# Altium schematic sheet USB Ports.SchDoc: USB Ports
size A3; DocumentNumber: 6; SheetNumber: 6; SheetTotal: 9
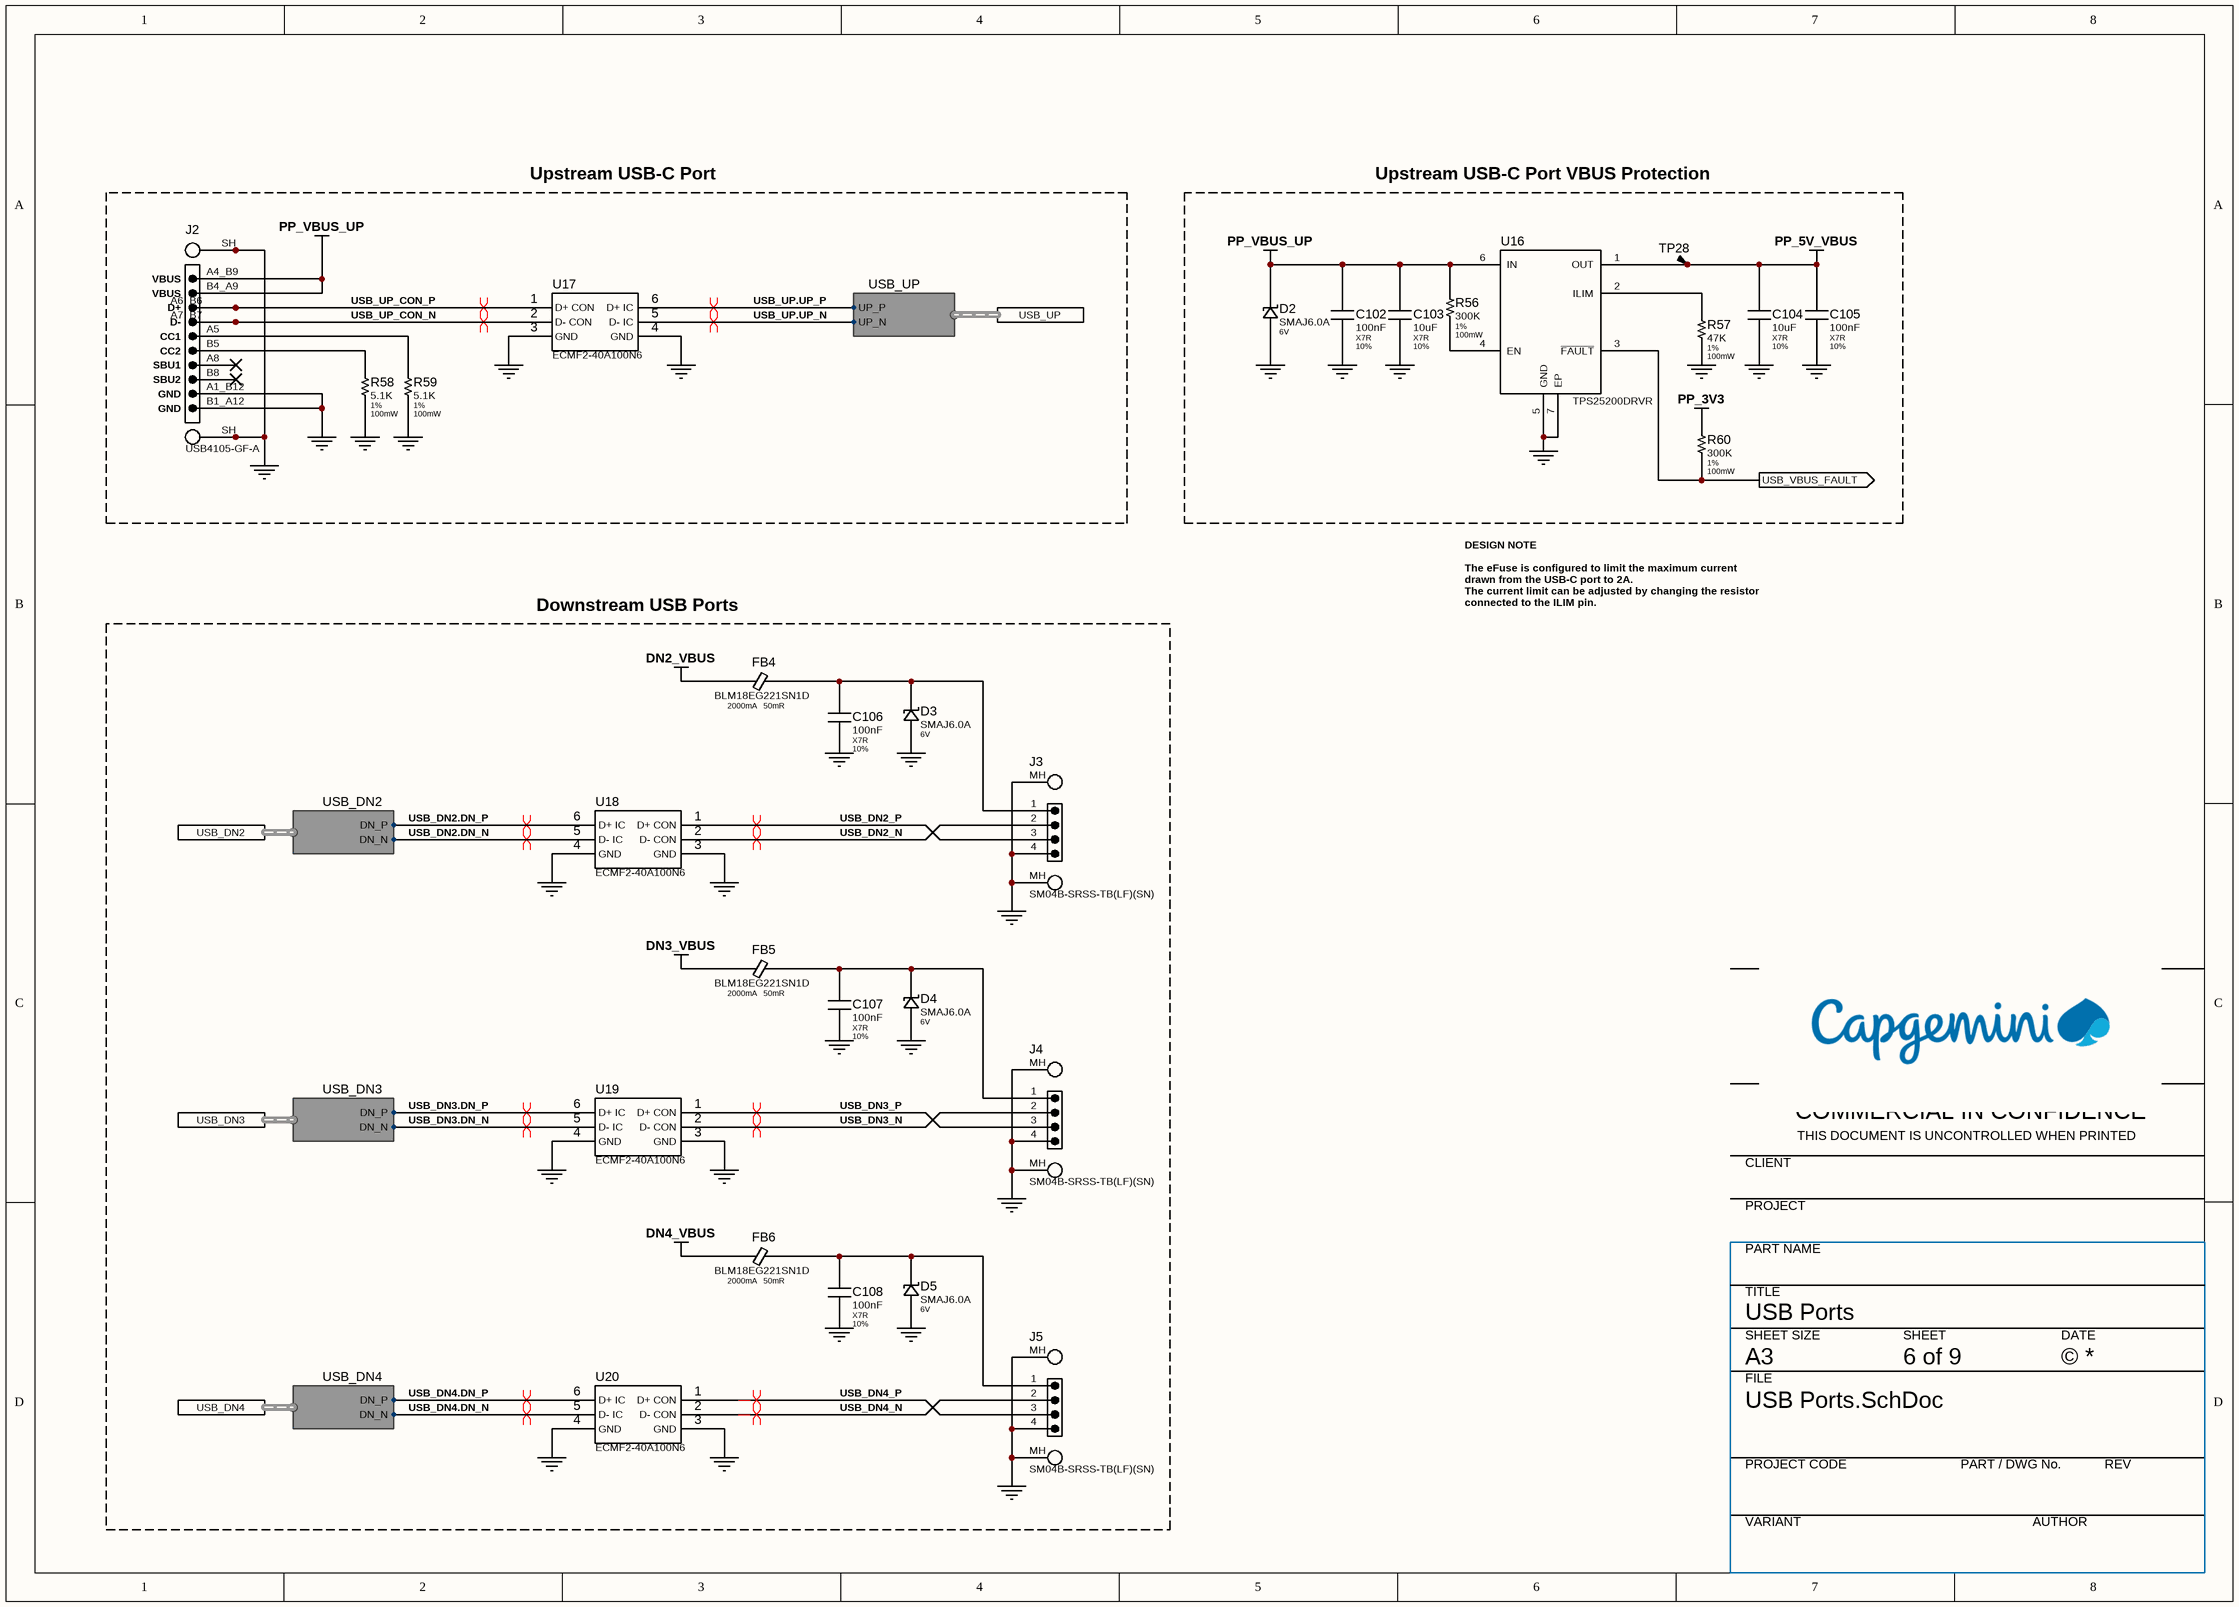
[diagram p0: USB Ports.SchDoc]

## Parts
C102  100nF  Dielectric: X7R  Tolerance: 10%  [MLCC-0402-N]
C103  10uF  Dielectric: X7R  Tolerance: 10%  [MLCC-1206-N]
C104  10uF  Dielectric: X7R  Tolerance: 10%  [MLCC-1206-N]
C105  100nF  Dielectric: X7R  Tolerance: 10%  [MLCC-0402-N]
C106  100nF  Dielectric: X7R  Tolerance: 10%  [MLCC-0402-N]
C107  100nF  Dielectric: X7R  Tolerance: 10%  [MLCC-0402-N]
C108  100nF  Dielectric: X7R  Tolerance: 10%  [MLCC-0402-N]
D2  SMAJ6.0A  Voltage - Reverse: 6V  [JEDEC-DO-214AC-N]
D3  SMAJ6.0A  Voltage - Reverse: 6V  [JEDEC-DO-214AC-N]
D4  SMAJ6.0A  Voltage - Reverse: 6V  [JEDEC-DO-214AC-N]
D5  SMAJ6.0A  Voltage - Reverse: 6V  [JEDEC-DO-214AC-N]
FB4  BLM18EG221SN1D  Current: 2000mA  ESR: 50mR  [FB-0603-N]
FB5  BLM18EG221SN1D  Current: 2000mA  ESR: 50mR  [FB-0603-N]
FB6  BLM18EG221SN1D  Current: 2000mA  ESR: 50mR  [FB-0603-N]
J2  USB4105-GF-A  [GCT USB4105-GF-A]
J3  SM04B-SRSS-TB(LF)(SN)  [SM04B-SRSS-TB(LF)(SN)]
J4  SM04B-SRSS-TB(LF)(SN)  [SM04B-SRSS-TB(LF)(SN)]
J5  SM04B-SRSS-TB(LF)(SN)  [SM04B-SRSS-TB(LF)(SN)]
R56  300K  Tolerance: 1%  Power: 100mW  [RES-0402-N]
R57  47K  Tolerance: 1%  Power: 100mW  [RES-0402-N]
R58  5.1K  Tolerance: 1%  Power: 100mW  [RES-0603-N]
R59  5.1K  Tolerance: 1%  Power: 100mW  [RES-0603-N]
R60  300K  Tolerance: 1%  Power: 100mW  [RES-0402-N]
TP28  TP-SMT-CIRCLE  [TP-1.0mm]  (value not drawn)  (no BOM)
U16  TPS25200DRVR  [SON65P200X200X80-7N]
U17  ECMF2-40A100N6  [ECMF240A100N6]
U18  ECMF2-40A100N6  [ECMF240A100N6]
U19  ECMF2-40A100N6  [ECMF240A100N6]
U20  ECMF2-40A100N6  [ECMF240A100N6]

## Blocks framed on the sheet
Upstream USB-C Port: J2 R58 R59 U17
Upstream USB-C Port VBUS Protection: C102-C105 D2 R56 R57 R60 TP28 U16
Downstream USB Ports: C106-C108 D3-D5 FB4-FB6 J3-J5 U18-U20

## Ports
USB_DN2 (harness USB_DN2), USB_DN3 (harness USB_DN3), USB_DN4 (harness USB_DN4), USB_UP (harness USB_UP), USB_VBUS_FAULT (out)

## Harnesses
USB_DN4: DN_P, DN_N
USB_DN2: DN_P, DN_N
USB_DN3: DN_P, DN_N
USB_UP: UP_P, UP_N

## Nets
DN2_VBUS: FB4.1
DN3_VBUS: FB5.1
DN4_VBUS: FB6.1
GND: C102.2 C103.2 C104.2 C105.2 C106.2 C107.2 C108.2 D2.A D3.A D4.A D5.A J2.A1_B12(GND) J2.B1_A12(GND) J2.SH1 J2.SH2 J2.SH3 J2.SH4 J3.4 J3.MH1(MH) J3.MH2(MH) J4.4 J4.MH1(MH) J4.MH2(MH) J5.4 J5.MH1(MH) J5.MH2(MH) R57.2 R58.2 R59.2 U16.5(GND) U16.7(EP) U17.3(GND) U17.4(GND) U18.3(GND) U18.4(GND) U19.3(GND) U19.4(GND) U20.3(GND) U20.4(GND)
PP_3V3: R60.1
PP_5V_VBUS: C104.1 C105.1 TP28.1 U16.1(OUT)
PP_VBUS_UP: C102.1 C103.1 D2.K J2.A4_B9(VBUS) J2.B4_A9(VBUS) R56.1 U16.6(IN)
USB_DN2.DN_N: U18.5(D-_IC) ; port USB_DN2.DN_N
USB_DN2.DN_P: U18.6(D+_IC) ; port USB_DN2.DN_P
USB_DN2_N: J3.2 U18.2(D-_CON)
USB_DN2_P: J3.3 U18.1(D+_CON)
USB_DN3.DN_N: U19.5(D-_IC) ; port USB_DN3.DN_N
USB_DN3.DN_P: U19.6(D+_IC) ; port USB_DN3.DN_P
USB_DN3_N: J4.2 U19.2(D-_CON)
USB_DN3_P: J4.3 U19.1(D+_CON)
USB_DN4.DN_N: U20.5(D-_IC) ; port USB_DN4.DN_N
USB_DN4.DN_P: U20.6(D+_IC) ; port USB_DN4.DN_P
USB_DN4_N: J5.2 U20.2(D-_CON)
USB_DN4_P: J5.3 U20.1(D+_CON)
USB_UP.UP_N: U17.5(D-_IC) ; port USB_UP.UP_N
USB_UP.UP_P: U17.6(D+_IC) ; port USB_UP.UP_P
USB_UP_CON_N: J2.A7(D-) J2.B7(D-) U17.2(D-_CON)
USB_UP_CON_P: J2.A6(D+) J2.B6(D+) U17.1(D+_CON)
USB_VBUS_FAULT: R60.2 U16.3(~{FAULT}) ; port USB_VBUS_FAULT
NetC106_1: C106.1 D3.K FB4.2 J3.1
NetC107_1: C107.1 D4.K FB5.2 J4.1
NetC108_1: C108.1 D5.K FB6.2 J5.1
NetJ2_A5: J2.A5(CC1) R59.1
NetJ2_B5: J2.B5(CC2) R58.1
NetR56_2: R56.2 U16.4(EN)
NetR57_1: R57.1 U16.2(ILIM)

Not connected (* = marked no-connect by the designer): J2 A8(SBU1)* B8(SBU2)*

## Layout directives
differential pair: USB_DN2.DN_N, USB_DN2.DN_P, USB_DN2_N, USB_DN2_P, USB_DN3.DN_N, USB_DN3.DN_P, USB_DN3_N, USB_DN3_P, USB_DN4.DN_N, USB_DN4.DN_P, USB_DN4_N, USB_DN4_P, USB_UP.UP_N, USB_UP.UP_P, USB_UP_CON_N, USB_UP_CON_P

## Notes on the sheet
- DESIGN NOTE
  The eFuse is configured to limit the maximum current drawn from the USB-C port to 2A.
  The current limit can be adjusted by changing the resistor connected to the ILIM pin.
- COMMERCIAL IN CONFIDENCE
- CLIENT
- THIS DOCUMENT IS UNCONTROLLED WHEN PRINTED
- PROJECT
- PART NAME
- TITLE
- SHEET SIZE
- SHEET
- DATE
- A3
- FILE
- PROJECT CODE
- PART / DWG No.
- REV
- VARIANT
- AUTHOR
- (in symbol CMP-0000002859-3) SH; A6, B6; A7, B7

## Library data of the parts
C102 C105-C108 = CMP-0000000712-3: CAP-CER-100nF-50V-0402-X7R-10%; Voltage: 50V; Value: 100nF
C103 C104 = CMP-0000002231-1: CAP-CER-10uF-50V-1206-X7R-10%; Voltage: 50V; Value: 10uF
D2-D5 = CMP-0000002064-3: DIODE-TVS-6V-SMAJ6.0A; Manufacturer Part Number: SMAJ6.0A-13-F; Manufacturer: Diodes Incorporated; Type: TVS; Current: 38.8A; ComponentLink1Description: Datasheet; ComponentLink1URL: https://www.diodes.com/assets/Datasheets/SMAJ5.0CA-SMAJ200CA.pdf
FB4-FB6 = CMP-00084-3: FB-220R@100MHz-2000mA-50mR-BLM18EG221SN1D; Manufacturer: Murata Electronics; Value: 220 Ohms @ 100MHz; Tolerance: 25%; ComponentLink1Description: Datasheet; Manufacturer Part Number: BLM18EG221SN1D; ComponentLink1URL: https://www.murata.com/en-us/products/productdata/8796747366430/ENFA0021.pdf
J2 = CMP-0000002859-3: CONN-GCT-USB-C-USB4105-GF-A; Manufacturer: GCT; ComponentLink1Description: Datasheet; Manufacturer Part Number: USB4105-GF-A; Type: USB C; ComponentLink1URL: https://mm.digikey.com/Volume0/opasdata/d220001/medias/docus/5492/USB4105.pdf
J3-J5 = CMP-0000003475-5: CONN-JST-SR/SZ-1x4-SM04B-SRSS-TB(LF)(SN); pin to pad: MH1>5 MH2>6; Manufacturer: JST; ComponentLink1URL: https://au.mouser.com/datasheet/3/1070/1/eSR_SZ.pdf; Manufacturer Part Number: SM04B-SRSS-TB(LF)(SN); Type: Header; ComponentLink1Description: Datasheet
R56 R60 = CMP-0000001775-1: RES-300K-0402-1%-100mW; Value: 300K
R57 = CMP-0000001685-1: RES-47K-0402-1%-100mW; Value: 47K
R58 R59 = CMP-0000000308-1: RES-5.1K-0603-1%-100mW; Value: 5.1K
TP28 = CMP-0000000822-22: Test Point, Circular SMT Style
U16 = CMP-0000003499-1: IC-eFuse-5V-TPS25200DRVR; Manufacturer: Texas Instruments; Manufacturer Part Number: TPS25200DRVR; ComponentLink1URL: https://www.ti.com/general/docs/suppproductinfo.tsp?distId=10&gotoUrl=https%3A%2F%2Fwww.ti.com%2Flit%2Fgpn%2Ftps25200; ComponentLink1Description: Datasheet
U17-U20 = CMP-0000003474-3: IC-USB-CMD-ESD-PROTECT-ECMF2-40A100N6; Manufacturer: STMicroelectronics; Manufacturer Part Number: ECMF2-40A100N6; ComponentLink1Description: Datasheet; ComponentLink1URL: https://www.st.com/resource/en/datasheet/ecmf2-40a100n6.pdf